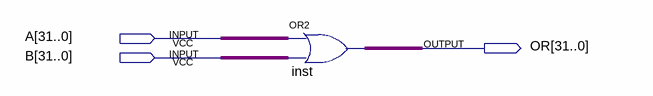
[diagram p0: schematic sheet]
// Quartus schematic Or_32bit.bdf as structural Verilog: 1 symbols, 3 pins
module Or_32bit (
  input  [31:0] A,
  input  [31:0] B,
  output [31:0] OR
);

  assign OR = A | B;  // OR2 inst, 32 bits wide
endmodule
